# EAGLE design pcb_khamex_zenit_V0.1_rev_5.0 (EAGLE 7.6.0)

## Sheet 1 of 2
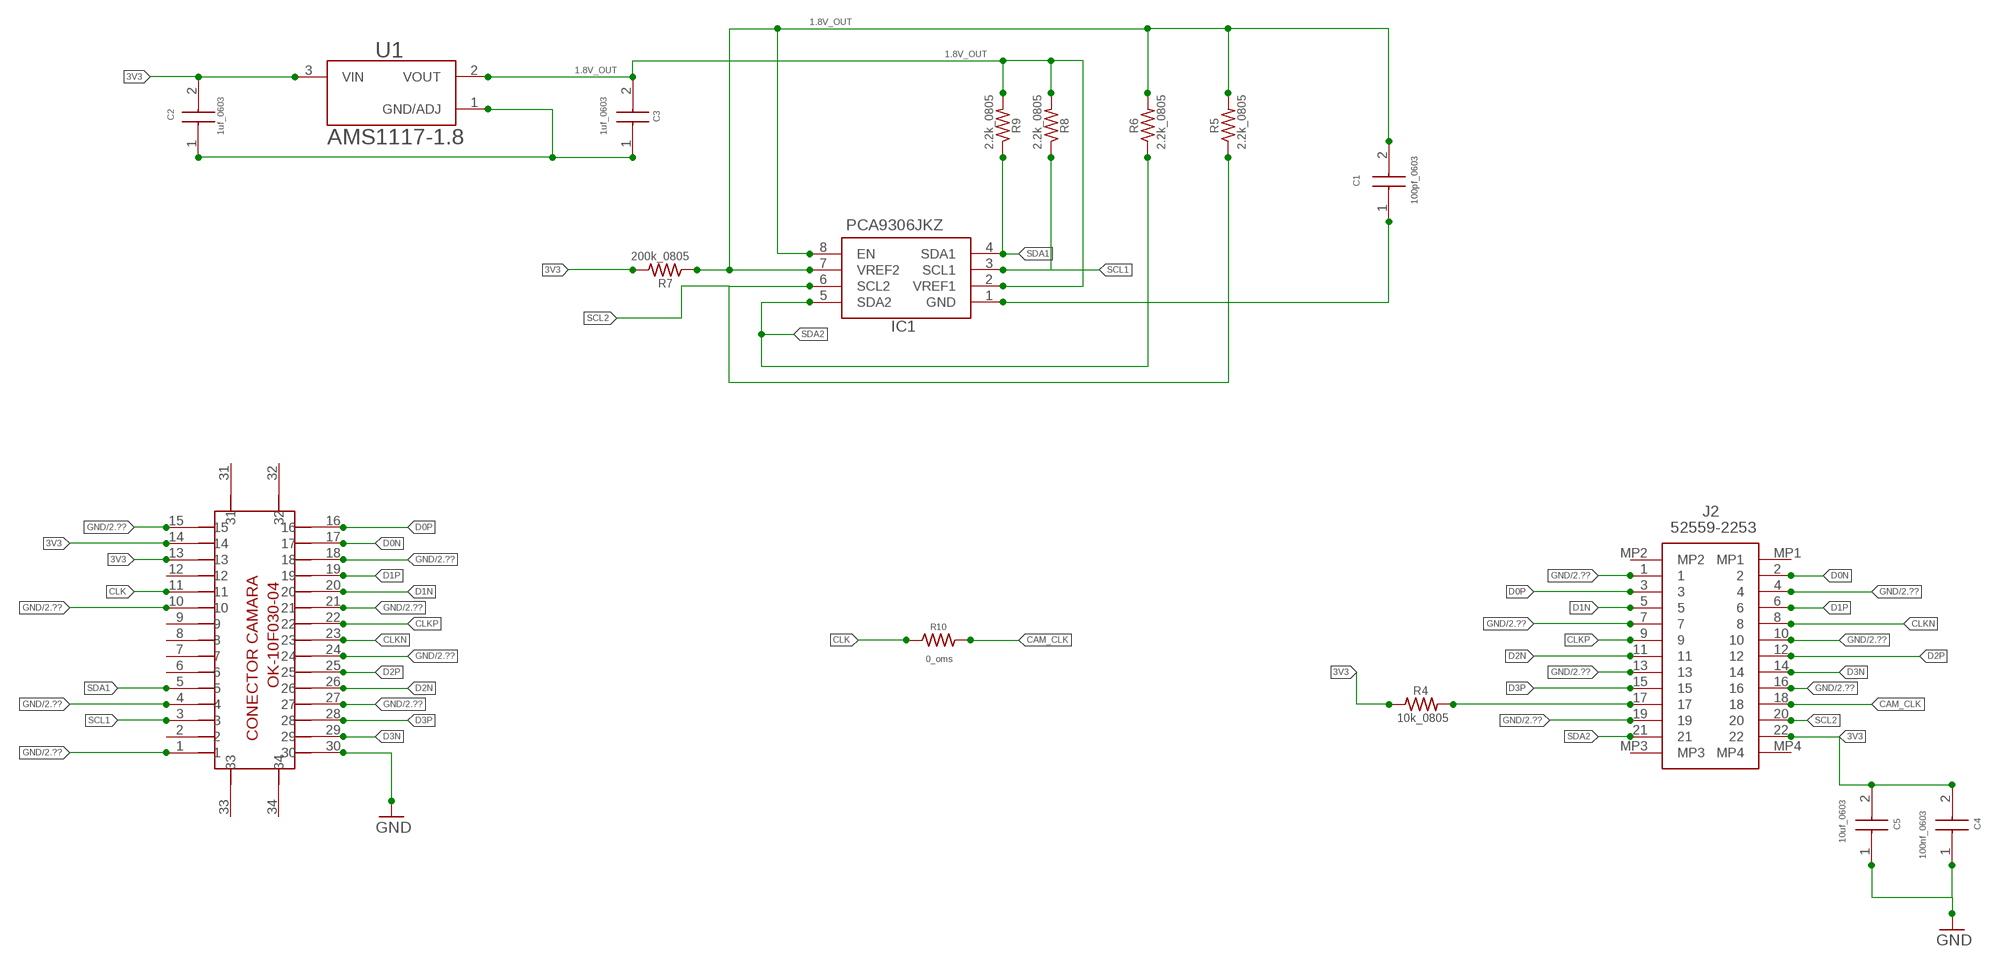
[diagram p0: schematic, sheet 1, part 1 of 2]
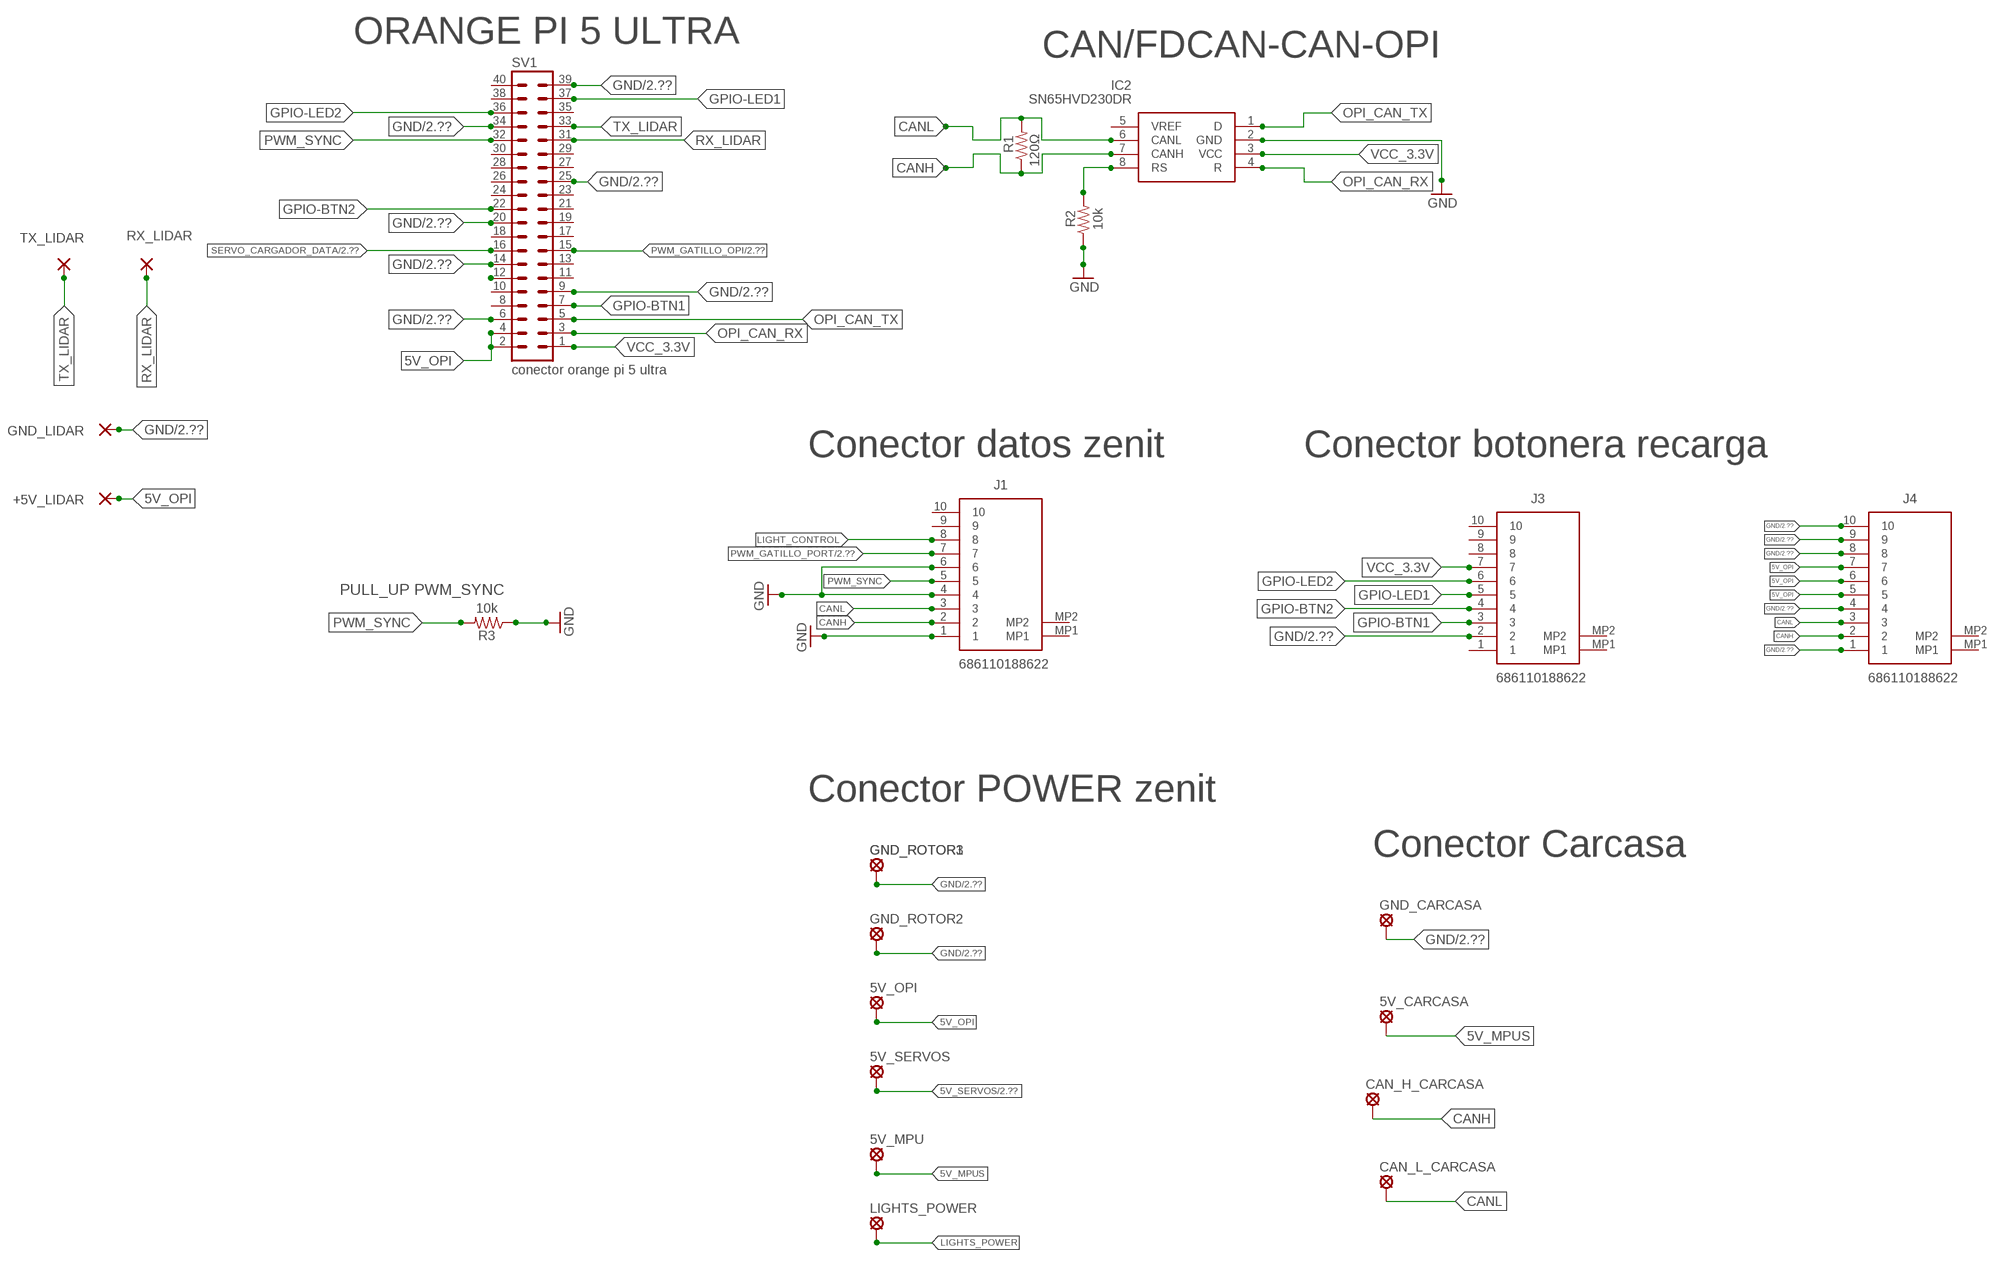
[diagram p1: schematic, sheet 1, part 2 of 2]

### Parts
5V_CARCASA  SE14  [SE14]
5V_MPU  SE14  [SE14]
5V_OPI  SE14  [SE14]
5V_SERVOS  SE14  [SE14]
+5V_LIDAR  WIREPAD1,6/0,8  [1,6/0,8]
C1  100pf_0603  06033U101FAT2A  [CAPC1608X90N]
C2  1uf_0603  06033U101FAT2A  [CAPC1608X90N]
C3  1uf_0603  06033U101FAT2A  [CAPC1608X90N]
C4  100nf_0603  06033U101FAT2A  [CAPC1608X90N]
C5  10uf_0603  06033U101FAT2A  [CAPC1608X90N]
CAN_H_CARCASA  SE14  [SE14]
CAN_L_CARCASA  SE14  [SE14]
GND_CARCASA  SE14  [SE14]
GND_LIDAR  WIREPAD1,6/0,8  [1,6/0,8]
GND_ROTOR1  SE14  [SE14]
GND_ROTOR2  SE14  [SE14]
GND_ROTOR3  SE14  [SE14]
IC1  PCA9306JKZ  [PCA9306JKZ]
IC2  SN65HVD230DR  [SOT127P600X175-8N]
J1  686110188622  [686110188622]
J2  52559-2253  [525592253]
J3  686110188622  [686110188622]
J4  686110188622  [686110188622]
LIGHTS_POWER  SE14  [SE14]
R1  120Ω  R-US_M0805  [M0805]
R2  10k  R-US_M0805  [M0805]
R3  10k  R-US_R0603  [R0603]
R4  10k_0805  R-US_M0805  [M0805]
R5  2.2k_0805  R-US_M0805  [M0805]
R6  2.2k_0805  R-US_M0805  [M0805]
R7  200k_0805  R-US_M0805  [M0805]
R8  2.2k_0805  R-US_M0805  [M0805]
R9  2.2k_0805  R-US_M0805  [M0805]
R10  0_oms  R-US_M0805  [M0805]
RX_LIDAR  WIREPAD1,6/0,8  [1,6/0,8]
SV1  conector orange pi 5 ultra  MA20-2  [MA20-2]
TX_LIDAR  WIREPAD1,6/0,8  [1,6/0,8]
U1  AMS1117-1.8  [SOT229P700X180-4N]
U$1  OK-10F030-04_DEVICE  [OK-10F030-04_PACKAGE]

### Nets
3V3: C2.2 C4.2 C5.2 J2.22 R4.1 R7.2 U1.3(VIN) U$1.13 U$1.14
5V_MPUS: 5V_CARCASA.MP 5V_MPU.MP
5V_OPI: 5V_OPI.MP +5V_LIDAR.1(P) J4.5 J4.6 J4.7 SV1.2 SV1.4
5V_SERVOS: 5V_SERVOS.MP ; also sheet 2
CAM_CLK: J2.18 R10.2
CANH: CAN_H_CARCASA.MP IC2.7(CANH) J1.2 J4.2 R1.1
CANL: CAN_L_CARCASA.MP IC2.6(CANL) J1.3 J4.3 R1.2
CLK: R10.1 U$1.11
CLKN: J2.8 U$1.23
CLKP: J2.9 U$1.22
D0N: J2.2 U$1.17
D0P: J2.3 U$1.16
D1N: J2.5 U$1.20
D1P: J2.6 U$1.19
D2N: J2.11 U$1.26
D2P: J2.12 U$1.25
D3N: J2.14 U$1.29
D3P [power]: J2.15 U$1.28
GND [power]: C4.1 C5.1 GND_CARCASA.MP GND_LIDAR.1(P) GND_ROTOR1.MP GND_ROTOR2.MP GND_ROTOR3.MP IC2.2(GND) J1.1 J1.4 J1.6 J2.1 J2.4 J2.7 J2.10 J2.13 J2.16 J2.19 J3.2 J4.1 J4.4 J4.8 J4.9 J4.10 R2.1 R3.1 SV1.6 SV1.9 SV1.14 SV1.20 SV1.25 SV1.34 SV1.39 U$1.1 U$1.4 U$1.10 U$1.15 U$1.18 U$1.21 U$1.24 U$1.27 U$1.30 ; also sheet 2
GPIO-BTN1: J3.3 SV1.7
GPIO-BTN2: J3.4 SV1.22
GPIO-LED1: J3.5 SV1.37
GPIO-LED2: J3.6 SV1.36
LIGHT_CONTROL: J1.8
LIGHTS_POWER [power]: LIGHTS_POWER.MP
N$1: C1.1 IC1.1(GND)
N$6: C1.2 IC1.7(VREF2) IC1.8(EN) R5.2 R6.2 R7.1
N$7: J2.17 R4.2
N$9: SV1.12
N$10: C2.1 C3.1 U1.1(GND/ADJ)
N$12: C3.2 IC1.2(VREF1) R8.2 R9.2 U1.2(VOUT)
N$15: IC2.8(RS) R2.2
OPI_CAN_RX: IC2.4(R) SV1.3
OPI_CAN_TX: IC2.1(D) SV1.5
PWM_GATILLO_OPI: SV1.15 ; also sheet 2
PWM_GATILLO_PORT: J1.7 ; also sheet 2
PWM_SYNC: J1.5 R3.2 SV1.32
RX_LIDAR: RX_LIDAR.1(P) SV1.31
SCL1: IC1.3(SCL1) R8.1 U$1.3
SCL2: IC1.6(SCL2) J2.20 R5.1
SDA1: IC1.4(SDA1) R9.1 U$1.5
SDA2: IC1.5(SDA2) J2.21 R6.1
SERVO_CARGADOR_DATA: SV1.16 ; also sheet 2
TX_LIDAR: SV1.33 TX_LIDAR.1(P)
VCC_3.3V: IC2.3(VCC) J3.7 SV1.1
Unconnected: IC2.5(VREF) J1.9 J1.10 J1.MP1 J1.MP2 J2.MP1 J2.MP2 J2.MP3 J2.MP4 J3.1 J3.8 J3.9 J3.10 J3.MP1 J3.MP2 J4.MP1 J4.MP2 SV1.8 SV1.10 SV1.11 SV1.13 SV1.17 SV1.18 SV1.19 SV1.21 SV1.23 SV1.24 SV1.26 SV1.27 SV1.28 SV1.29 SV1.30 SV1.35 SV1.38 SV1.40 U$1.2 U$1.6 U$1.7 U$1.8 U$1.9 U$1.12 U$1.31 U$1.32 U$1.33 U$1.34

### Notes on the sheet
- 1.8V_OUT
- 1.8V_OUT
- 1.8V_OUT
- ORANGE PI 5 ULTRA
- CAN/FDCAN-CAN-OPI
- Conector datos zenit | Conector botonera recarga
- PULL_UP PWM_SYNC
- Conector POWER zenit
- Conector Carcasa

## Sheet 2 of 2
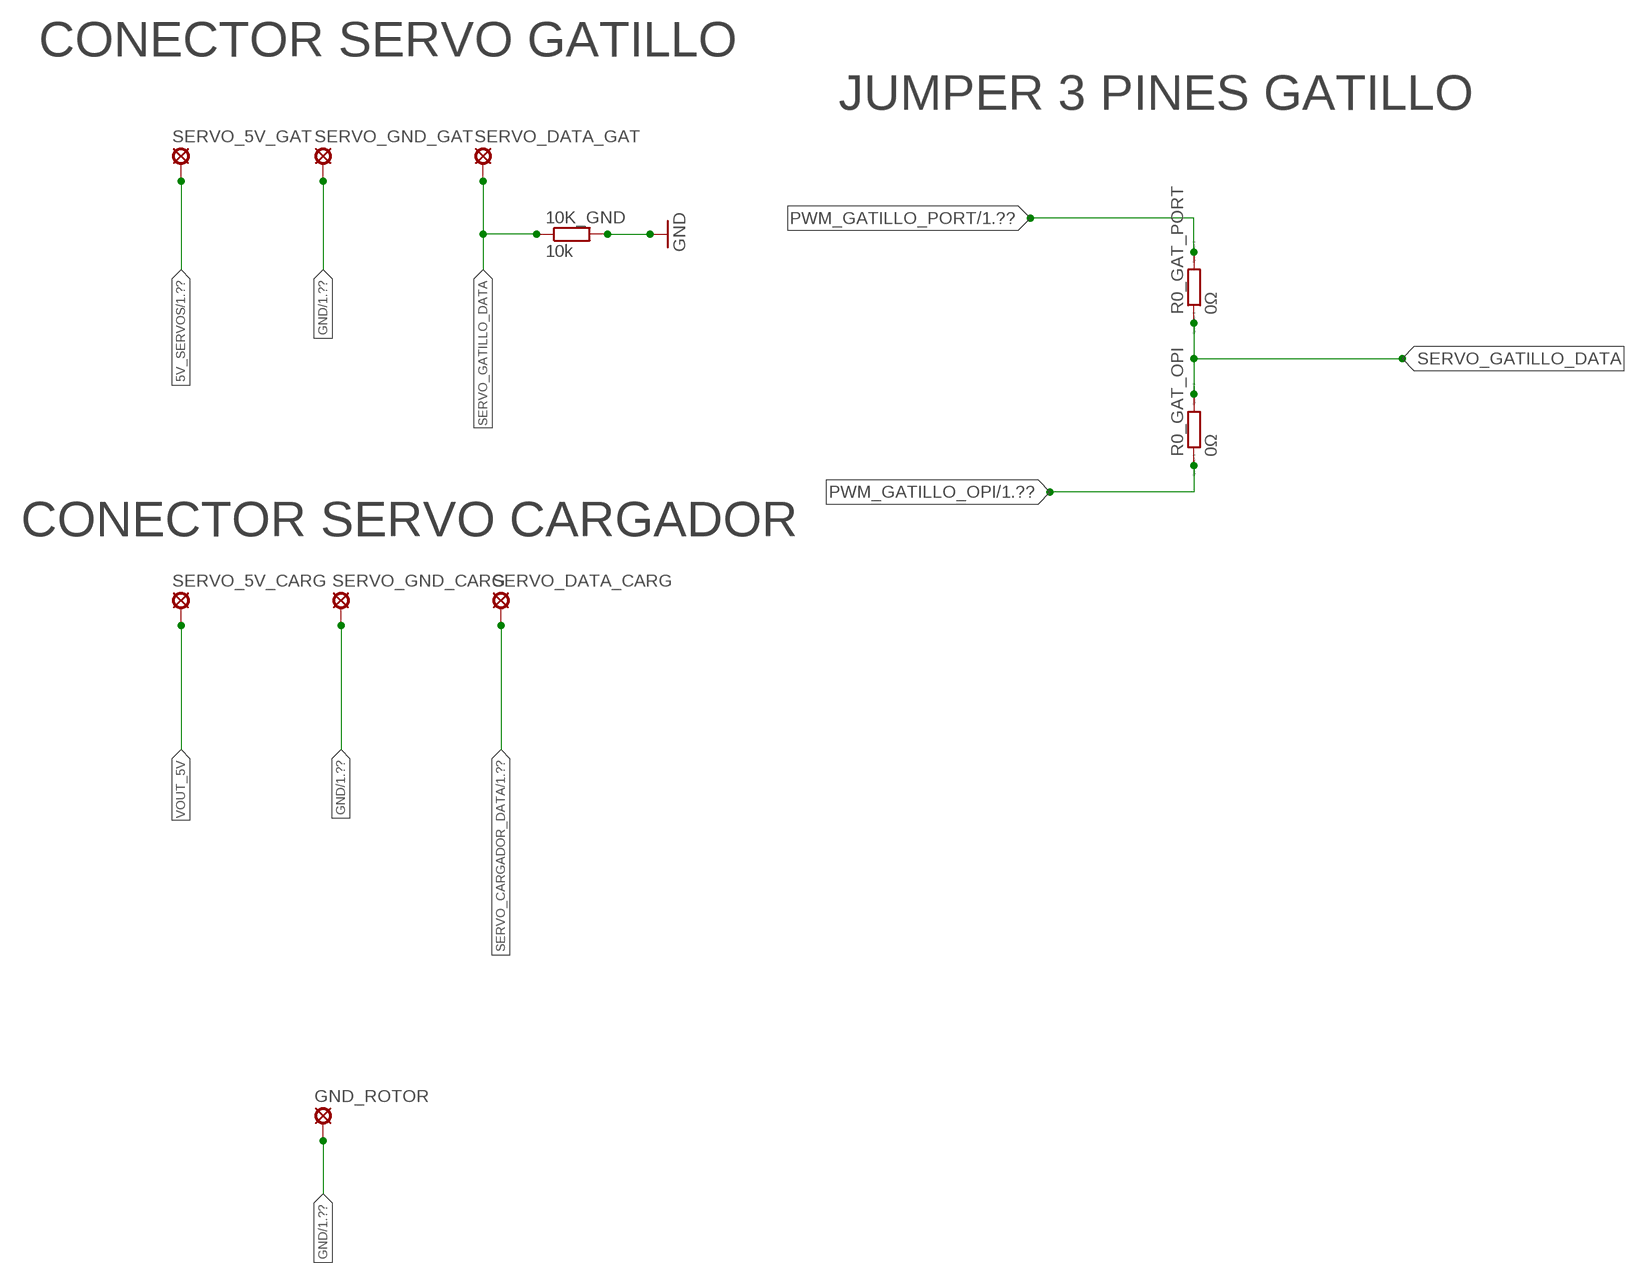
[diagram p2: schematic, sheet 2]

### Parts
10K_GND  10k  R-EU_R0603  [R0603]
GND_ROTOR  SE14  [SE14]
R0_GAT_OPI  0Ω  RR0603  [R0603]
R0_GAT_PORT  0Ω  RR0603  [R0603]
SERVO_5V_CARG  SE14  [SE14]
SERVO_5V_GAT  SE14  [SE14]
SERVO_DATA_CARG  SE14  [SE14]
SERVO_DATA_GAT  SE14  [SE14]
SERVO_GND_CARG  SE14  [SE14]
SERVO_GND_GAT  SE14  [SE14]

### Nets
5V_SERVOS: SERVO_5V_GAT.MP ; also sheet 1
GND [power]: 10K_GND.2 GND_ROTOR.MP SERVO_GND_CARG.MP SERVO_GND_GAT.MP ; also sheet 1
PWM_GATILLO_OPI: R0_GAT_OPI.1 ; also sheet 1
PWM_GATILLO_PORT: R0_GAT_PORT.2 ; also sheet 1
SERVO_CARGADOR_DATA: SERVO_DATA_CARG.MP ; also sheet 1
SERVO_GATILLO_DATA: 10K_GND.1 R0_GAT_OPI.2 R0_GAT_PORT.1 SERVO_DATA_GAT.MP
VOUT_5V: SERVO_5V_CARG.MP

### Notes on the sheet
- CONECTOR SERVO GATILLO
- JUMPER 3 PINES GATILLO
- CONECTOR SERVO CARGADOR

## Library data of the parts
5V_CARCASA 5V_MPU 5V_OPI 5V_SERVOS CAN_H_CARCASA CAN_L_CARCASA GND_CARCASA GND_ROTOR GND_ROTOR1-GND_ROTOR3 LIGHTS_POWER SERVO_5V_CARG SERVO_5V_GAT SERVO_DATA_CARG SERVO_DATA_GAT SERVO_GND_CARG SERVO_GND_GAT = solpad:SE14: SOLDER PAD E1553, drill 1,4mm, distributor Buerklin, 07F820
10K_GND = rcl_dani:R-EU_: RESISTOR, European symbol
+5V_LIDAR GND_LIDAR RX_LIDAR TX_LIDAR = wirepad:WIREPAD: Wire PAD connect wire on PCB
C1-C5 = 06033U101FAT2A:06033U101FAT2A: Multilayer Ceramic Capacitors MLCC - SMD/SMT 25V 100pF C0G 0603 1% Tol Source: Datasheet <https://componentsearchengine.com/Datasheets/1/06031A100FAT2A.pdf>; DESCRIPTION: Multilayer Ceramic Capacitors MLCC - SMD/SMT 25V 100pF C0G 0603 1% Tol; HEIGHT: 0.9mm; MANUFACTURER_NAME: Kyocera AVX; MANUFACTURER_PART_NUMBER: 06033U101FAT2A
IC1 = PCA9306JKZ:PCA9306JKZ: Voltage Level Translator Bidirectional 1 Circuit 2 Channel 8-X2SON (1.35x1) , 1.8 V ~ 5.5 V , -40C ~ 105C (TA) Source: Datasheet <https://www.nxp.com/docs/en/data-sheet/PCA9306.pdf>; DESCRIPTION: Voltage Level Translator Bidirectional 1 Circuit 2 Channel 8-X2SON (1.35x1) , 1.8 V ~ 5.5 V , -40C ~ 105C (TA); HEIGHT: 0.33mm; MANUFACTURER_NAME: NXP; MANUFACTURER_PART_NUMBER: PCA9306JKZ
IC2 = SN65HVD230DR:SN65HVD230DR: 3.3 V CAN Transceiver with Standby Mode Source: Datasheet <http://www.ti.com/lit/gpn/sn65hvd230>; DESCRIPTION: 3.3 V CAN Transceiver with Standby Mode; HEIGHT: 1.75mm; MANUFACTURER_NAME: Texas Instruments; MANUFACTURER_PART_NUMBER: SN65HVD230DR; MOUSER_PART_NUMBER: 595-SN65HVD230DR; MOUSER_PRICE-STOCK: https://www.mouser.co.uk/ProductDetail/Texas-Instruments/SN65HVD230DR?qs=QViXGNcIEAtifeQR3pYVUQ%3D%3D
J1 J3 J4 = 686110188622:686110188622: FFC & FPC Connectors WR-FPC 1,0mm SMT Horiz. Top Contact Tin Plating{0000} Source: Datasheet <https://www.mouser.ch/datasheet/2/445/686110188622-1843591.pdf>; DESCRIPTION: FFC & FPC Connectors WR-FPC 1,0mm SMT Horiz. Top Contact Tin Plating{0000}; HEIGHT: 3.3mm; MANUFACTURER_NAME: Wurth Elektronik; MANUFACTURER_PART_NUMBER: 686110188622; MOUSER_PART_NUMBER: 710-686110188622; MOUSER_PRICE-STOCK: https://www.mouser.co.uk/ProductDetail/Wurth-Elektronik/686110188622?qs=OlC7AqGiEDnHUpT6yh27Lg%3D%3D
J2 = 52559-2253:52559-2253: 0.5 MM FPC CONNECTOR Source: Datasheet; DESCRIPTION: 0.5 MM FPC CONNECTOR; HEIGHT: 5.55mm; MANUFACTURER_NAME: Molex; MANUFACTURER_PART_NUMBER: 52559-2253; MOUSER_PART_NUMBER: 538-52559-2253; MOUSER_PRICE-STOCK: https://www.mouser.co.uk/ProductDetail/Molex/52559-2253?qs=nDwhpid8gJaCOR81Wp3jsw%3D%3D
R0_GAT_OPI R0_GAT_PORT = eagle-ltspice:R: RESISTOR, European symbol; SPICEMODEL: NONE; SPICEPREFIX: R
R1-R10 = rcl:R-US_: RESISTOR, American symbol
SV1 = con-lstb:MA20-2: PIN HEADER; OC_FARNELL: unknown; OC_NEWARK: unknown
U1 = AMS1117-1.8:AMS1117-1.8: Check availability <https://pricing.snapeda.com/parts/AMS1117-1.8-TR/ams/view-part?ref=eda>; AVAILABILITY: Not in stock; CHECK_PRICES: https://www.snapeda.com/parts/AMS1117-1.8-TR/ams/view-part/?ref=eda; MF: ams; MP: AMS1117-1.8-TR; PACKAGE: SOT-223 Seeed Technology; PRICE: None; SNAPEDA_LINK: https://www.snapeda.com/parts/AMS1117-1.8-TR/ams/view-part/?ref=snap
U$1 = OK-10F030-04_LIBRARY_2:OK-10F030-04_DEVICE: Conector para las camaras del Orange Pi 5 Ultra 30 pines click

## Net classes
0 default: width 0.152 mm, drill 0.305 mm, clearance 0.152 mm
1 power: width 0.127 mm, drill 0.305 mm, clearance 0.127 mm
2 thin: width 0.254 mm, drill 0.254 mm, clearance 0.254 mm
3 mipi: width 0.15 mm, drill 0.2 mm, clearance 0.15 mm

## Board
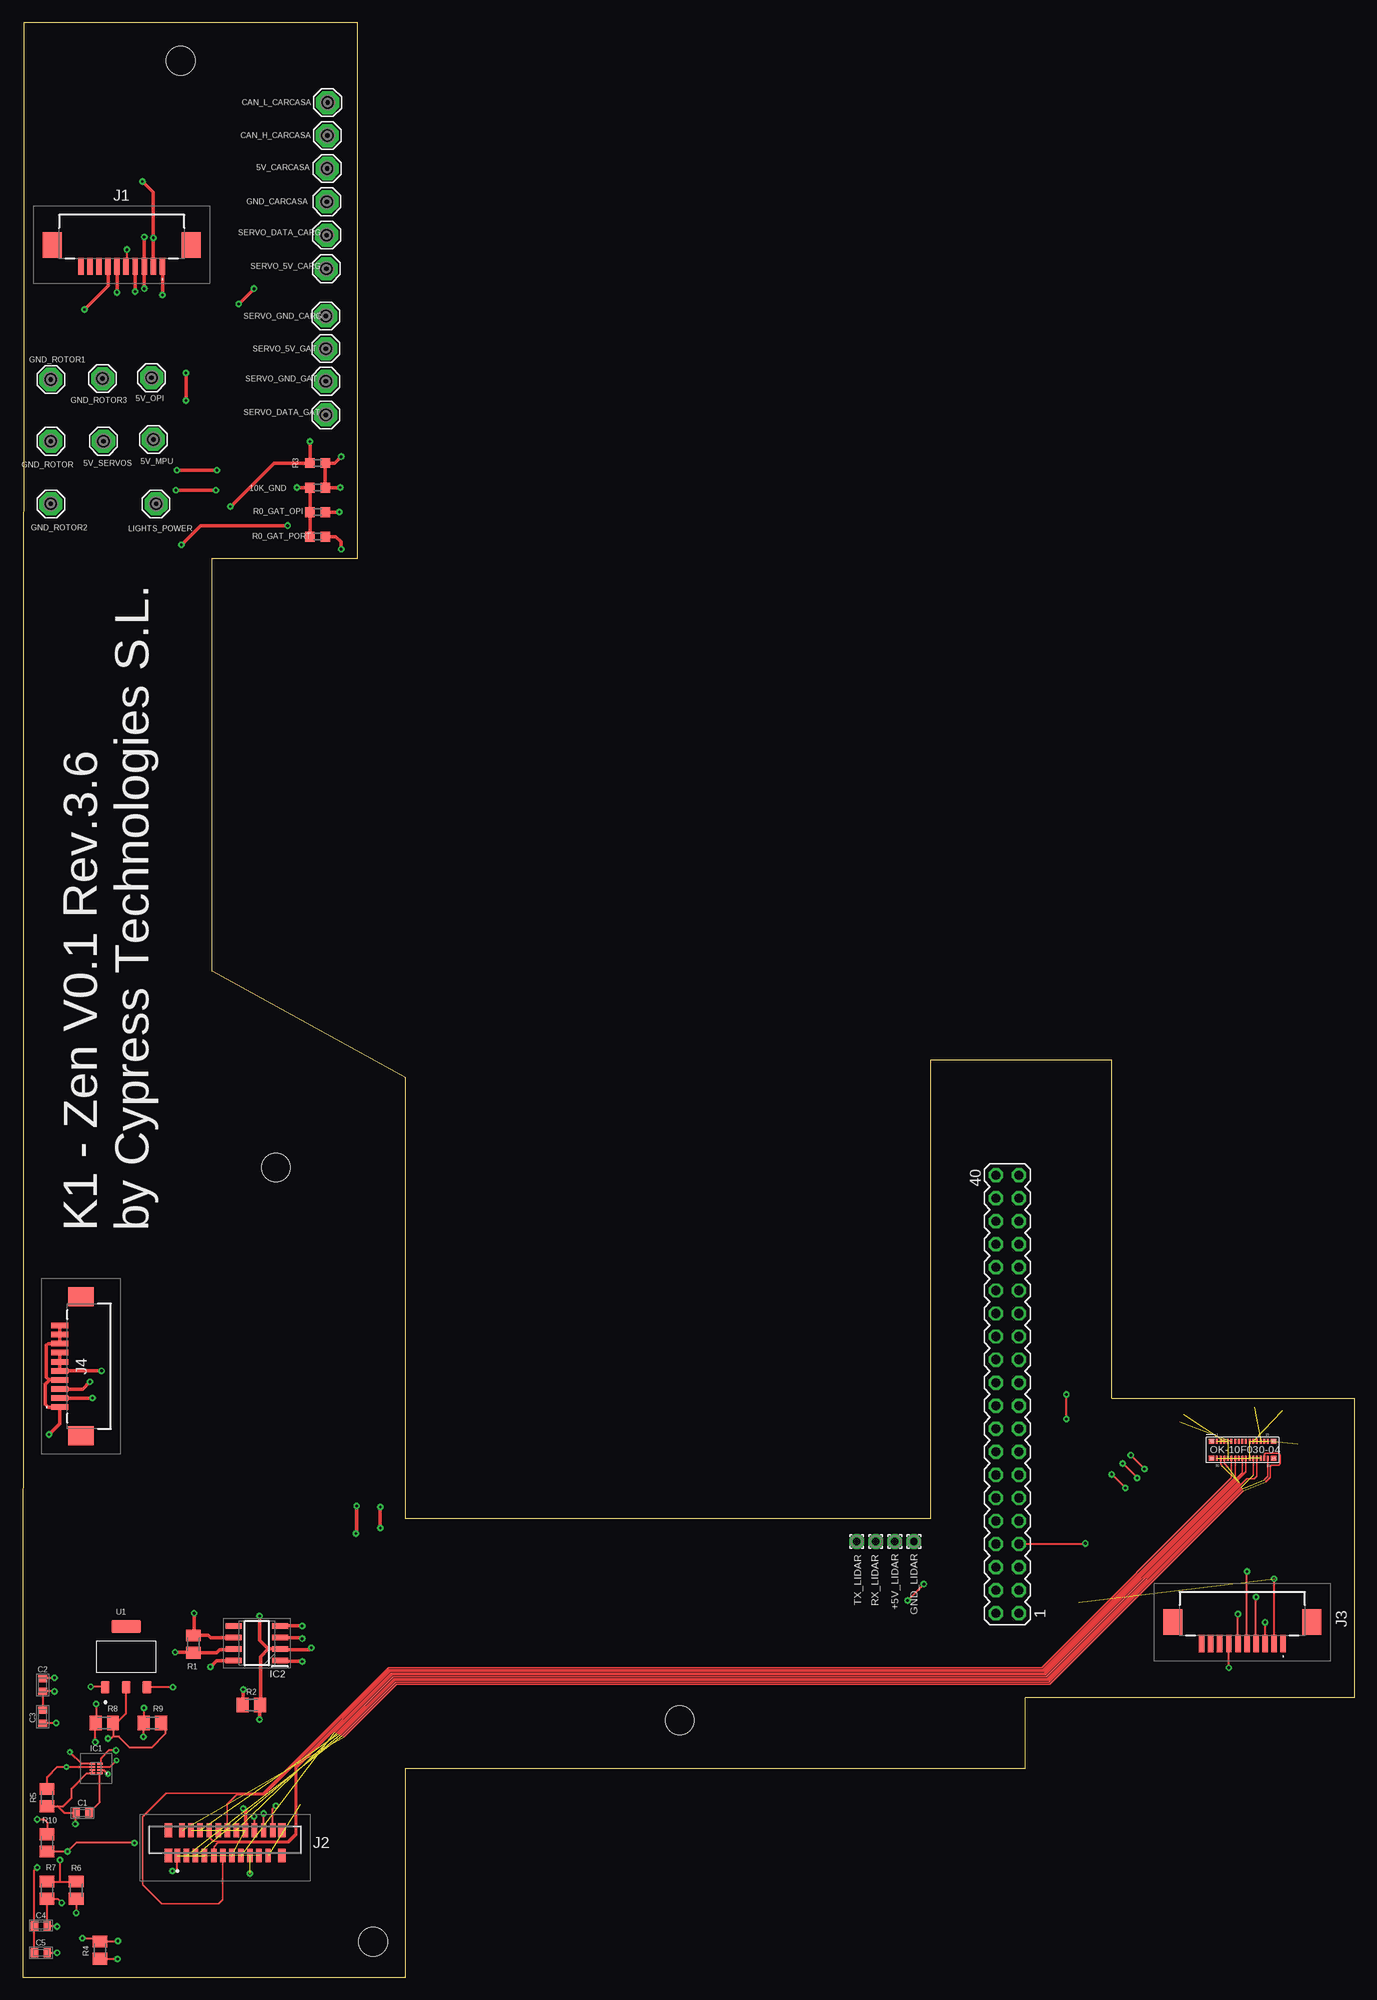
[diagram p3: board, top side]
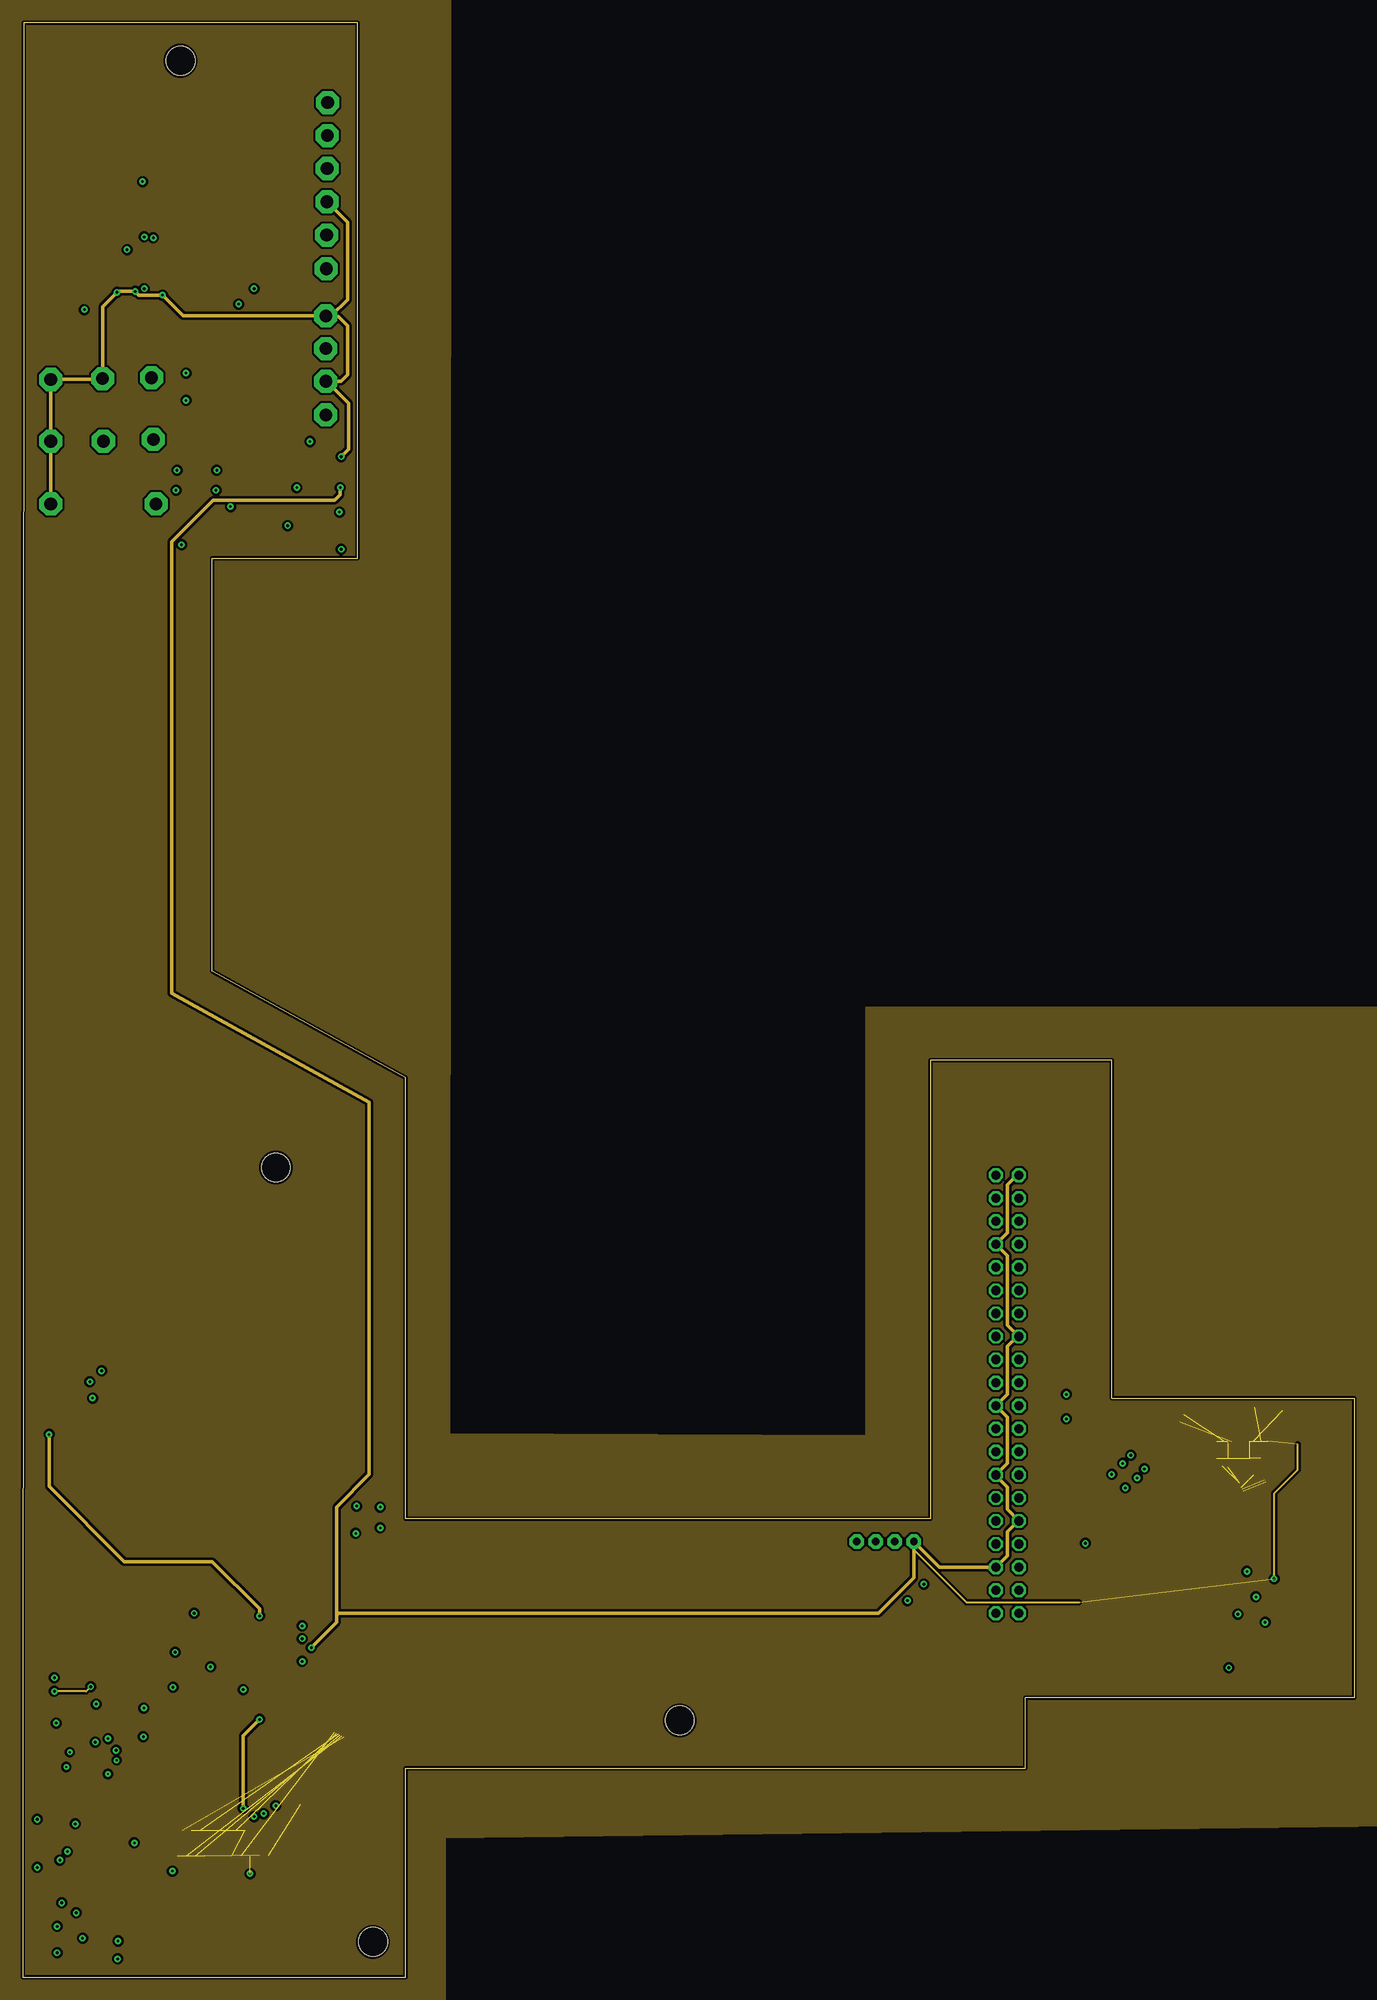
[diagram p4: board, inner layer GND_PLANE]
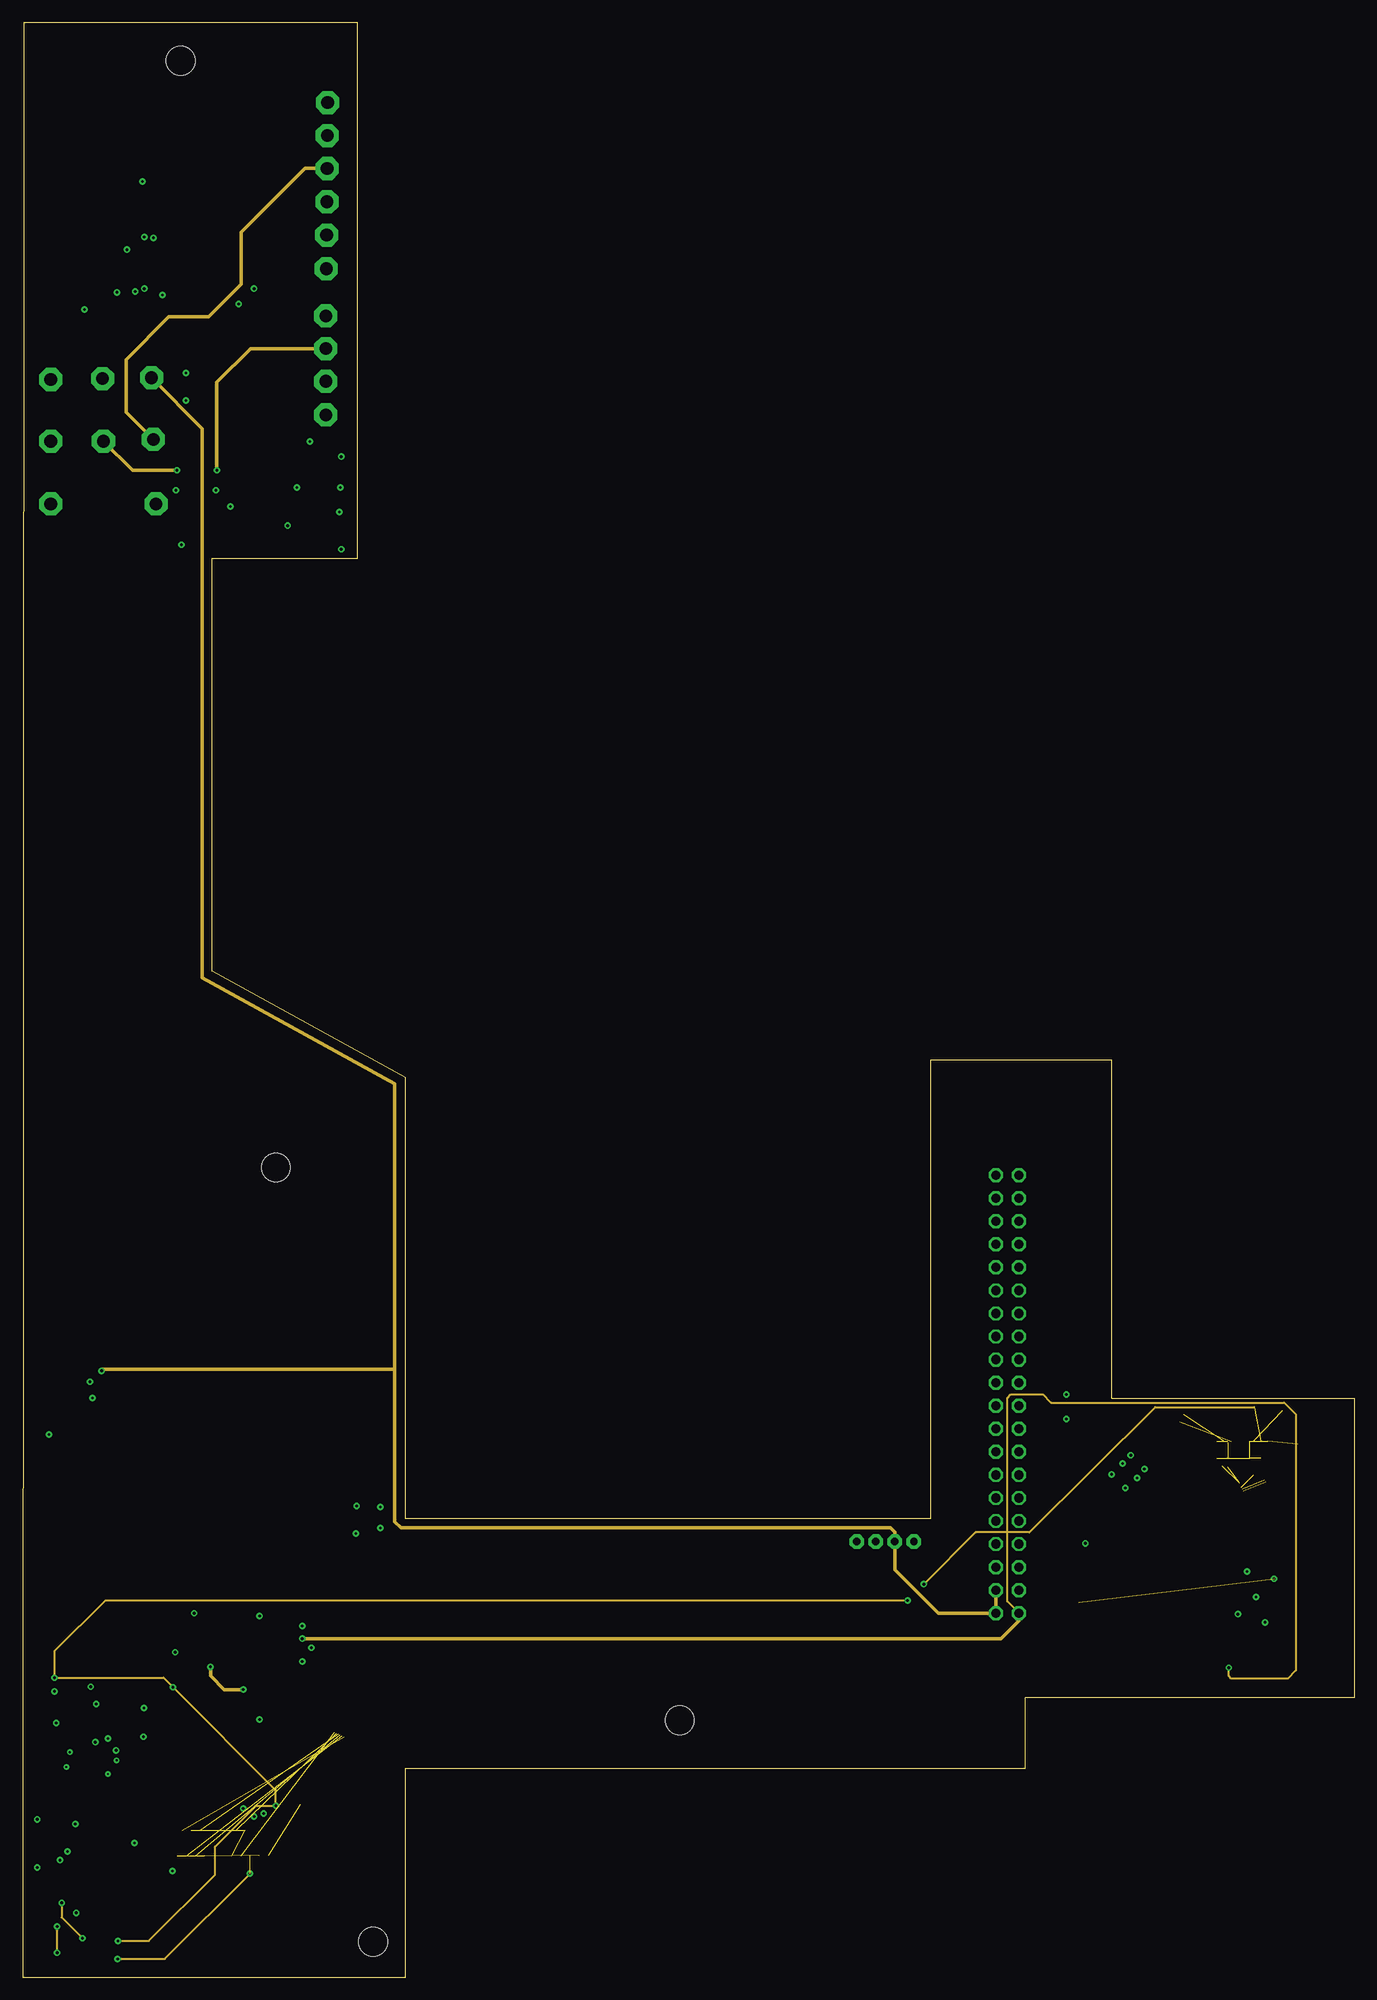
[diagram p5: board, inner layer POWER]
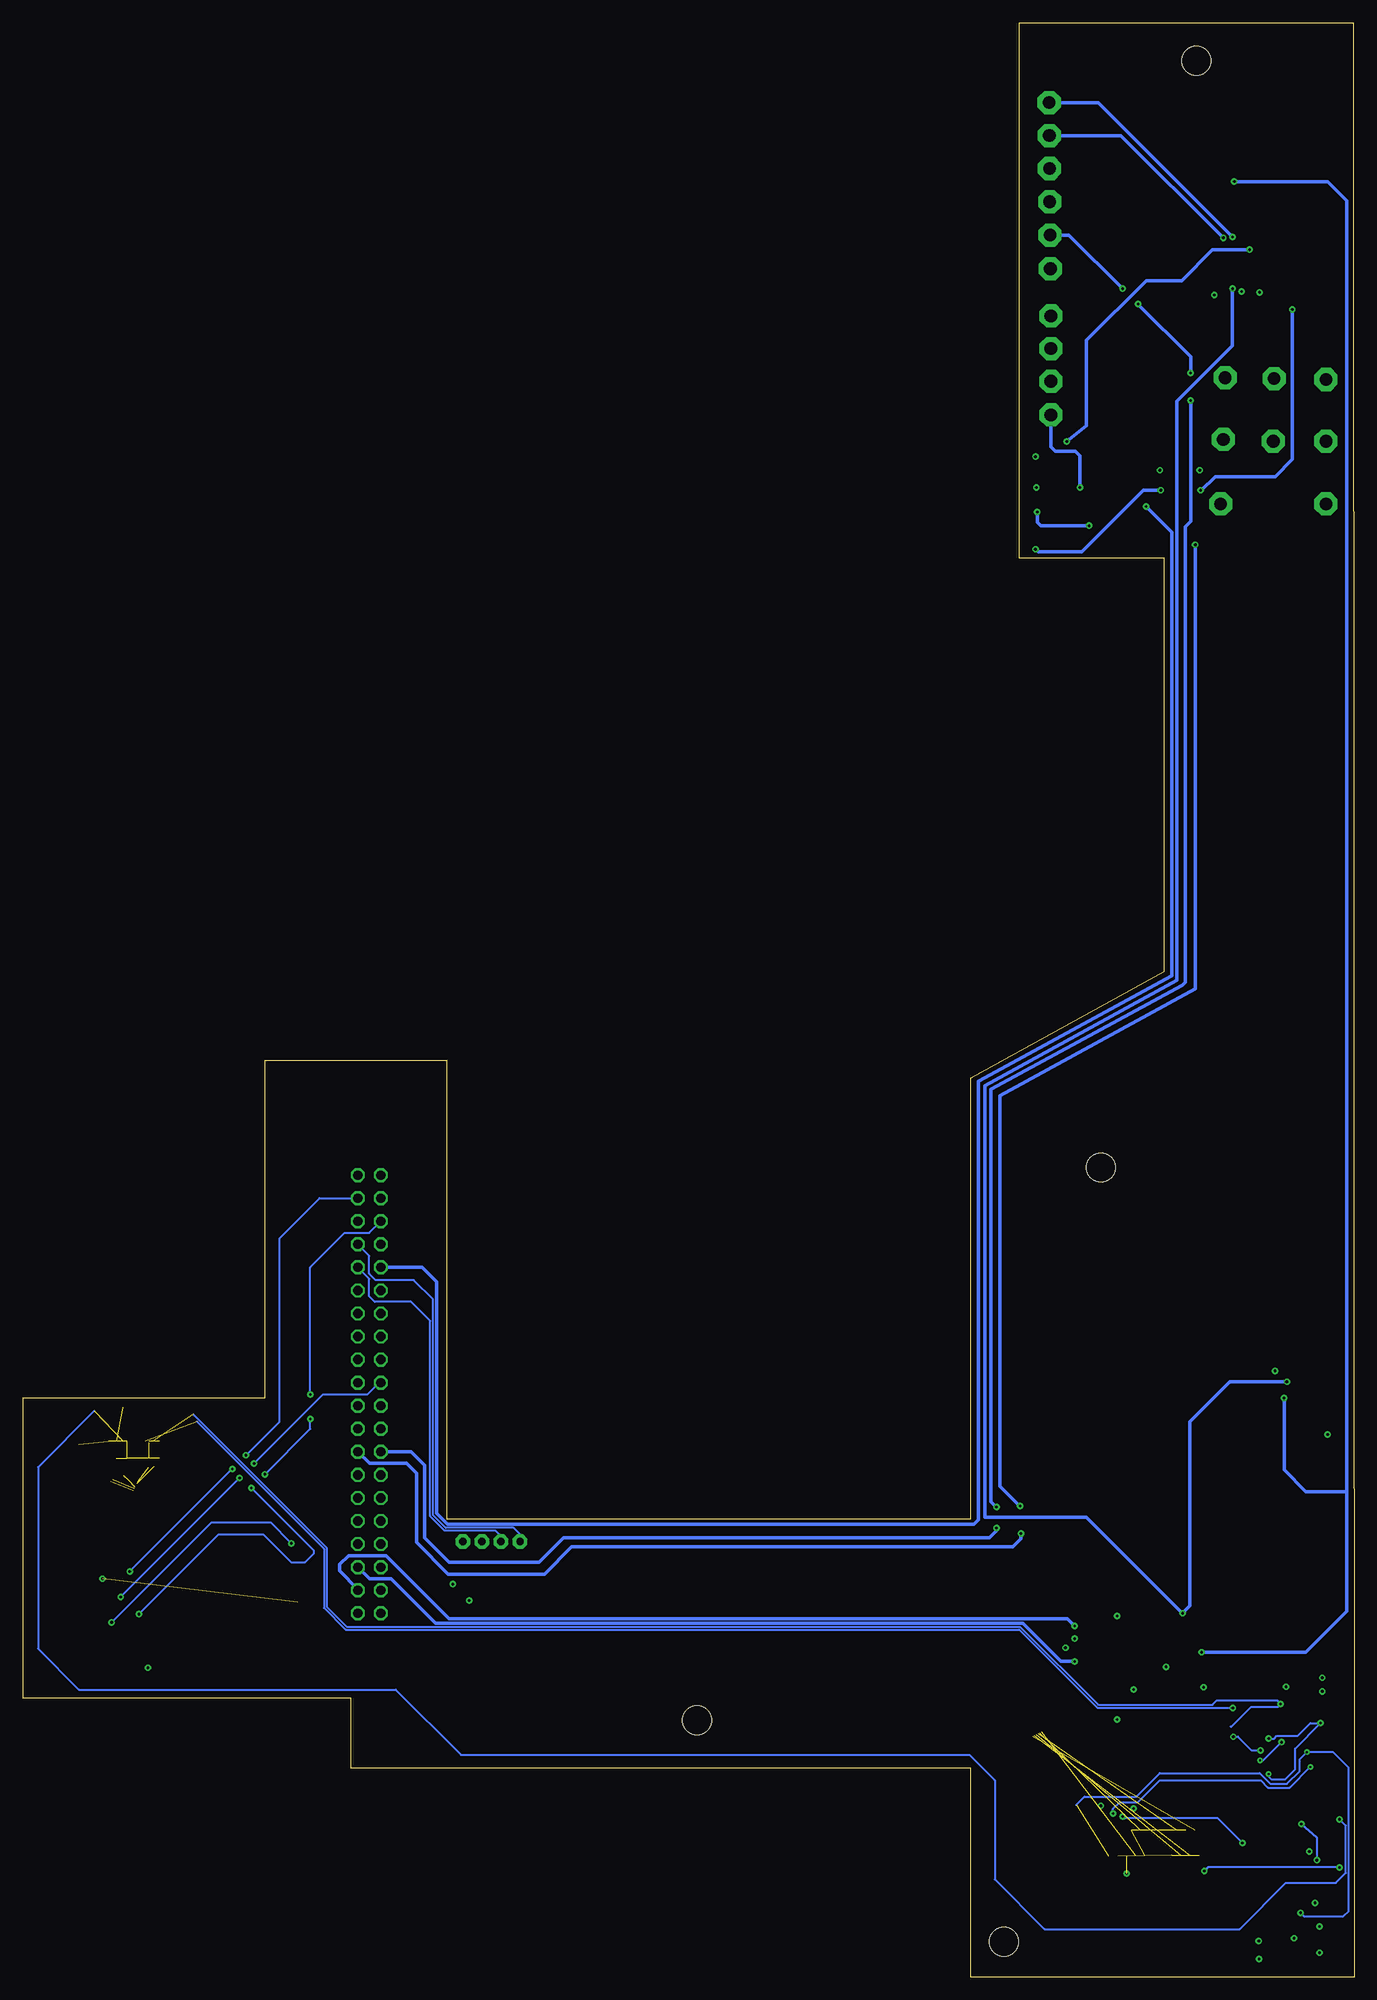
[diagram p6: board, bottom side, seen from below]

Size 146.7 x 215.3 mm. Coordinates in mm from the lower left corner, seen from the top.
Outline: 0,0 42.2,0 42.2,23 110.5,23 110.5,30.8 146.7,30.8 146.7,63.8 120,63.8 120,101 100,101 100,50.5 42.2,50.5 42.2,99.1 20.9,110.8 20.9,156.3 36.9,156.3 36.9,215.3 0.1,215.3 0,0
Copper layers (1*2*15*16): Top 0.035mm / dielectric 1.5mm / GND_PLANE 0.035mm / dielectric 0.15mm / POWER 0.035mm / dielectric 0.2mm / Bottom 0.035mm
Design rules "default *": minimum track width 10mil, minimum drill 24mil, track to track 8mil, track to pad 8mil, pad to pad 8mil, via to via 8mil, smd to smd 8mil, copper to edge 10mil, drill to drill 8mil, minimum pad ring 10mil, minimum via ring 8mil, stop-mask expansion 4mil, vias tented up to drill 0mil, thermal gap 10mil
Holes 3.2 mm at 17.4,211.1 72.4,28.3 38.6,3.9 27.9,89.2

### Footprints (pad centres in the part's own frame; a part is rotated, then mirrored left to right if it is on the bottom)
SE14 = drill 1.397 pad 2.54 octagon: MP 0,0
R0603 = smd 1 x 1.1: 1 -0.85,0; 2 0.85,0
1,6/0,8 = drill 0.813 pad 1.6 octagon: 1 0,0
CAPC1608X90N = smd 0.78 x 0.99: 1 -0.7,0; 2 0.7,0
PCA9306JKZ = smd 0.65 x 0.17: 1 -0.4,0.525 | smd 0.6 x 0.17: 2 -0.425,0.175; 3 -0.425,-0.175; 4 -0.425,-0.525; 5 0.425,-0.525; 6 0.425,-0.175; 7 0.425,0.175; 8 0.425,0.525
SOT127P600X175-8N = smd 1.75 x 0.6: 1 -2.55,1.905; 2 -2.55,0.635; 3 -2.55,-0.635; 4 -2.55,-1.905; 5 2.55,-1.905; 6 2.55,-0.635; 7 2.55,0.635; 8 2.55,1.905
686110188622 = smd 0.6 x 1.9: 1 -4.5,2.825; 2 -3.5,2.825; 3 -2.5,2.825; 4 -1.5,2.825; 5 -0.5,2.825; 6 0.5,2.825; 7 1.5,2.825; 8 2.5,2.825; 9 3.5,2.825; 10 4.5,2.825 | smd 2.1 x 2.8: MP1 -7.65,0.475; MP2 7.65,0.475
525592253 = smd 0.6 x 1.5: 1 -5.25,-1.4; 2 -4.75,1.4; 3 -4.25,-1.4; 4 -3.75,1.4; 5 -3.25,-1.4; 6 -2.75,1.4; 7 -2.25,-1.4; 8 -1.75,1.4; 9 -1.25,-1.4; 10 -0.75,1.4; 11 -0.25,-1.4; 12 0.25,1.4; 13 0.75,-1.4; 14 1.25,1.4; 15 1.75,-1.4; 16 2.25,1.4; 17 2.75,-1.4; 18 3.25,1.4; 19 3.75,-1.4; 20 4.25,1.4; 21 4.75,-1.4; 22 5.25,1.4 | smd 0.8 x 1.5: MP1 -6.25,1.4; MP2 -6.25,-1.4; MP3 6.25,-1.4; MP4 6.25,1.4
M0805 = smd 1.3 x 1.6: 1 -0.95,0; 2 0.95,0
MA20-2 = drill 1.016 octagon: 1 -24.13,-1.27; 2 -24.13,1.27; 3 -21.59,-1.27; 4 -21.59,1.27; 5 -19.05,-1.27; 6 -19.05,1.27; 7 -16.51,-1.27; 8 -16.51,1.27; 9 -13.97,-1.27; 10 -13.97,1.27; 11 -11.43,-1.27; 12 -11.43,1.27; 13 -8.89,-1.27; 14 -8.89,1.27; 15 -6.35,-1.27; 16 -6.35,1.27; 17 -3.81,-1.27; 18 -3.81,1.27; 19 -1.27,-1.27; 20 -1.27,1.27; 21 1.27,-1.27; 22 1.27,1.27; 23 3.81,-1.27; 24 3.81,1.27; 25 6.35,-1.27; 26 6.35,1.27; 27 8.89,-1.27; 28 8.89,1.27; 29 11.43,-1.27; 30 11.43,1.27; 31 13.97,-1.27; 32 13.97,1.27; 33 16.51,-1.27; 34 16.51,1.27; 35 19.05,-1.27; 36 19.05,1.27; 37 21.59,-1.27; 38 21.59,1.27; 39 24.13,-1.27; 40 24.13,1.27
SOT229P700X180-4N = smd 1.31 x 0.93: 1 -3.345,2.29; 2 -3.345,0; 3 -3.345,-2.29 | smd 1.31 x 3.24: 4 3.345,0
OK-10F030-04_PACKAGE = smd 0.22 x 0.55: 1 -2.8,0.925; 2 -2.4,0.925; 3 -2,0.925; 4 -1.6,0.925; 5 -1.2,0.925; 6 -0.8,0.925; 7 -0.4,0.925; 8 0,0.925; 9 0.4,0.925; 10 0.8,0.925; 11 1.2,0.925; 12 1.6,0.925; 13 2,0.925; 14 2.4,0.925; 15 2.8,0.925; 16 2.8,-0.925; 17 2.4,-0.925; 18 2,-0.925; 19 1.6,-0.925; 20 1.2,-0.925; 21 0.8,-0.925; 22 0.4,-0.925; 23 0,-0.925; 24 -0.4,-0.925; 25 -0.8,-0.925; 26 -1.2,-0.925; 27 -1.6,-0.925; 28 -2,-0.925; 29 -2.4,-0.925; 30 -2.8,-0.925 | smd 0.6 x 0.55: 31 -3.4,0.925; 32 -3.39,-0.935; 33 3.42,0.935; 34 3.42,-0.925

### Placement (x,y rotation side)
5V_CARCASA  33.55,199.24 180 top
5V_MPU  14.4,169.4 270 top
5V_OPI  14.2,176.2 270 top
5V_SERVOS  8.9,169.2 270 top
10K_GND  32.5,164.1 0 top
+5V_LIDAR  96.1,48 180 top
C1  6.6,18.1 180 top
C2  2.2,32.2 90 top
C3  2.2,28.7 270 top
C4  2,5.7 0 top
C5  2,2.7 0 top
CAN_H_CARCASA  33.57,202.87 180 top
CAN_L_CARCASA  33.6,206.5 180 top
GND_CARCASA  33.53,195.58 180 top
GND_LIDAR  98.2,48 180 top
GND_ROTOR  3.1,169.2 0 top
GND_ROTOR1  3.1,176 270 top
GND_ROTOR2  3.1,162.3 270 top
GND_ROTOR3  8.8,176.1 90 top
IC1  8.1,23 180 top
IC2  25.8,36.8 180 top
J1  10.9,191.3 180 top
J2  22.3,14.8 0 top
J3  134.4,39.6 180 top
J4  6.9,67.3 90 top
LIGHTS_POWER  14.7,162.3 270 top
R0_GAT_OPI  32.5,161.4 180 top
R0_GAT_PORT  32.5,158.7 0 top
R1  18.8,36.7 90 top
R2  25.2,30 180 top
R3  32.5,166.8 180 top
R4  8.5,3 270 top
R5  2.7,19.8 270 top
R6  5.9,9.6 90 top
R7  2.7,9.6 270 top
R8  9,28 0 top
R9  14.3,28 0 top
R10  2.7,14.8 270 top
RX_LIDAR  94,48 180 top
SERVO_5V_CARG  33.46,188.2 0 top
SERVO_5V_GAT  33.4,179.4 0 top
SERVO_DATA_CARG  33.5,191.9 0 top
SERVO_DATA_GAT  33.4,172.1 0 top
SERVO_GND_CARG  33.4,183 0 top
SERVO_GND_GAT  33.4,175.8 0 top
SV1  108.5,64.23 90 top
TX_LIDAR  91.9,48 180 top
U1  11.4,35.3 90 top
U$1  134.4,58.1 0 top

### Tracks (layer width: path | path; a pad name or v marks a point on that pad's centre or on a via)
3V3  (via drill 0.3, 0.3 pad 0.2)  (2 unrouted)
  Top 0.2: C5.2 v3.8,2.7 | v3.8,5.6 2.8,5.6 C4.2 R7.2 3.85,8.65 v4.3,8.2 | v6.6,4.3 8.15,4.3 R4.1 10.45,3.95 v10.5,4 | J2.22 27.55,18.55 v27.9,18.9 | v16.57,31.95 U1.3 | C2.2 2.3,33 v3.5,33 | v99.3,43.3 v97.5,41.5
  POWER 0.2: v3.8,2.7 v3.8,5.6 | v4.3,8.2 4.3,6.6 v6.6,4.3 | v10.5,4 13.9,4 21.2,11.3 21.2,14.4 25.7,18.9 v27.9,18.9 27.9,20.62 v16.57,31.95 15.52,33 v3.5,33 3.5,35.9 9.1,41.5 v97.5,41.5 | v99.3,43.3 105,49 110.9,49 124.8,62.8 135.7,62.8
5V_MPUS
  POWER 0.406: 5V_CARCASA.MP 31.14,199.24 24.1,192.2 24.1,186.5 20.5,182.9 16.1,182.9 11.4,178.2 11.4,172.4 5V_MPU.MP
5V_OPI  (via drill 0.3)
  Top 0.406: J4.7 J4.6 J4.5 v8.7,66.8
  POWER 0.406: 5V_OPI.MP 19.8,170.6 19.8,110.1 41,98.4 41,67 | 41,67 41,50.2 41.7,49.5 95.6,49.5 96.1,49 +5V_LIDAR.1 96.1,44.9 100.9,40.1 SV1.2 SV1.4 | v8.7,66.8 8.7,67 41,67
5V_SERVOS  (via drill 0.3)
  Top 0.406: v21.4,166 v17,166
  POWER 0.406: SERVO_5V_GAT.MP 25.1,179.4 21.4,175.7 v21.4,166 | v17,166 12.1,166 5V_SERVOS.MP
CAM_CLK  (via drill 0.3, 0.3 pad 0.2, 0.3 pad 0.3)
  Top 0.2: J2.18 arc90 25.5,16.15 | v12.3,14.8 5.88,14.8 v4.93,13.85 R10.2 | 25.6,16.25 J2.18 | v25.5,17.7 25.5,16.25 J2.18
  Bottom 0.2: v12.3,14.8 15,17.5 25.3,17.5 v25.5,17.7
CANH  (via drill 0.3)
  Top 0.406: IC2.7 23.18,36.1 21.7,36.1 21.35,35.75 R1.1 18.75,35.8 v16.8,35.8 | J1.2 v14.4,191.6 14.4,196.6 v13.2,197.8 | J4.2 v7.7,63.8
  Bottom 0.406: CAN_H_CARCASA.MP 25.67,202.87 v14.4,191.6 | v13.2,197.8 2.9,197.8 0.8,195.7 0.8,53.4 | 0.8,53.4 0.8,40.3 5.3,35.8 v16.8,35.8 | v7.7,63.8 7.7,55.9 5.3,53.5 0.9,53.5 0.8,53.4
CANL  (via drill 0.3)
  Top 0.406: v13.4,191.7 J1.3 v13.4,186 | v18.9,40.1 18.9,37.75 R1.2 20.45,37.65 20.7,37.4 23.21,37.4 IC2.6 | J4.3 6.6,64.8 v7.4,65.6
  Bottom 0.406: CAN_L_CARCASA.MP 28.2,206.5 v13.4,191.7 | v13.4,186 13.4,179.7 19.5,173.6 19.5,109.8 40.7,98.2 40.7,50.7 29.5,50.7 v18.9,40.1 18.1,40.9 18.1,61.2 13.7,65.6 v7.4,65.6
CLK  (via drill 0.3)  (1 unrouted)
  Top 0.2: v1.6,17.4 2.4,17.4 2.7,17.1 R10.1
  Bottom 0.2: 138.8,62.4 145,56.2 145,36.2 140.5,31.7 105.6,31.7 98.4,24.5 42.4,24.5 39.6,21.7 39.6,10.8 34.1,5.3 12.6,5.3 7.5,10.4 2,10.4 0.9,11.5 0.9,16.7 v1.6,17.4
CLKN
  Top 0.15: J2.8 20.55,15.45 21,15 29.2,15 30,15.8 30,23.2 40.5,33.7 112.5,33.7 134.4,55.6 U$1.23
CLKP
  Top 0.15: J2.9 21.1,13.45 21.1,14.4 21.5,14.8 29.3,14.8 30.2,15.7 30.2,23.1 40.6,33.5 112.6,33.5 134.8,55.7 U$1.22
  Top 0.2: J2.9 21.05,12.75
D0N  (2 unrouted)
  Top 0.15: 35.4,26.5 41.2,32.3 113.2,32.3 134.5,53.6 | U$1.17 136.8,57.6 136.9,57.7 138.4,57.7 138.6,57.5 138.6,56.6 138.4,56.4 137.6,56.4 137.5,56.3 137.5,55.1 137,54.6
D0P  (2 unrouted)
  Top 0.15: 134.4,53.8 113.1,32.5 41.1,32.5 35.2,26.6 | U$1.16 137.2,55.2 136.8,54.8
D1N  (3 unrouted)
  Top 0.15: 35,26.7 41,32.7 113,32.7 134.3,54 | U$1.20 135.6,55.3
D1P  (1 unrouted)
  Top 0.15: 34.8,26.8 40.9,32.9 112.9,32.9 134.9,54.9 135.7,54.9 136,55.2 U$1.19
D2N
  Top 0.15: J2.11 22.05,8.55 21.6,8.1 15.3,8.1 13.2,10.2 13.2,17.7 15.8,20.3 26.5,20.3 40.3,34.1 112.3,34.1 133.2,55 U$1.26
D2P
  Top 0.15: J2.12 22.55,19.05 23.6,20.1 26.6,20.1 40.4,33.9 112.4,33.9 133.6,55.1 U$1.25
D3N  (2 unrouted)
  Top 0.15: 34.6,26.9 40.8,33.1 112.8,33.1 134.1,54.4 | U$1.29 132,56.5 132.2,56.3
  Top 0.2: J2.14
D3P  (2 unrouted)
  Top 0.15: 34.4,27 40.7,33.3 112.7,33.3 134,54.6 | U$1.28 132.4,56.6 132.8,56.2
GND  (via drill 0.3, 0.3 pad 0.2)  (16 unrouted)
  Top 0.2: C5.1 C4.1 1.3,11.8 v1.6,12.1 | v16.5,11.7 16.98,11.7 17.02,11.74 17.02,13.37 J2.1 | 20.08,13.43 J2.7 | J2.10 | 23.07,13.42 J2.13 | 24.53,16.18 J2.16 | J3.2 v137.9,43.9 | U$1.4 132.8,58.9
  Top 0.406: 27.07,36.16 IC2.2 28.41,36.1 31.6,36.1 v31.8,36.3 | 27.07,36.16 26.2,35.3 26.2,30.05 R2.1 arc90 26.1,29.95 v26.1,28.4 | v24.3,18.6 24.55,18.35 J2.16 | J1.1 v15.4,185.3 | J1.4 v12.4,185.7 | v10.4,185.6 J1.6 | v35.1,167.5 34.4,166.8 R3.1 10K_GND.2 v35,164.1 | J4.10 J4.9 J4.8 2.8,69.8 2.6,69.6 2.6,66.1 2.9,65.8 J4.4 3,65.8 2.5,65.3 2.5,63.1 2.8,62.8 J4.1 4.08,60.98 v2.9,59.8 | v26.1,39.8 26.1,37.13 27.07,36.16
  GND_PLANE 0.2: v137.9,43.9 137.9,53.3 140.5,55.9 140.5,58.7 | GND_LIDAR.1 98.2,47.1 104,41.3 116.4,41.3
  GND_PLANE 0.406: SV1.39 109.56,88.36 108.5,87.3 108.5,82.01 SV1.34 107.26,80.74 108.5,79.5 108.5,71.85 SV1.25 109.58,70.58 108.5,69.5 108.5,64.23 SV1.20 108.5,61.7 108.5,56.61 SV1.14 107.23,55.27 108.5,54 108.5,51.53 SV1.9 109.66,50.26 108.5,49.1 108.5,46.45 SV1.6 101.02,45.18 GND_LIDAR.1 98.2,44 94.3,40.1 34.8,40.1 34.6,39.9 | v26.1,28.4 24.3,26.6 v24.3,18.6 | GND_ROTOR2.MP GND_ROTOR.MP GND_ROTOR1.MP 8.7,176 GND_ROTOR3.MP 8.8,184 v10.4,185.6 10.5,185.7 v12.4,185.7 12.8,185.3 v15.4,185.3 17.7,183 SERVO_GND_CARG.MP 33.9,183 | GND_CARCASA.MP 35.8,193.31 35.8,184.8 34,183 33.9,183 | 33.9,183 34,182.9 34.8,182.9 35.8,181.9 35.8,176.5 35.1,175.8 SERVO_GND_GAT.MP 33.5,175.8 35.9,173.4 35.9,168.3 v35.1,167.5 | v35,164.1 35,163.3 34.4,162.7 21,162.7 16.4,158.1 16.4,108.4 38.2,96.4 38.2,55.4 34.6,51.8 34.6,39.9 | 34.6,39.9 34.6,39.1 v31.8,36.3 | v2.9,59.8 2.9,54.1 11.2,45.8 20.9,45.8 26.1,40.6 v26.1,39.8
  POWER 0.406: 33.3,182.9 arc90 SERVO_GND_CARG.MP
  Bottom 0.2: v1.6,12.1 16.1,12.1 v16.5,11.7
GPIO-BTN1  (via drill 0.3)
  Top 0.2: J3.3 v136.9,39.1 | v117.1,47.8 117.1,47.72 SV1.7
  Bottom 0.2: v136.9,39.1 125.89,50.11 119.38,50.11 117.1,47.83 v117.1,47.8 117.18,47.72
GPIO-BTN2  (via drill 0.3)
  Top 0.2: J3.4 v135.9,41.9 | v122.8,55 v121.2,56.6
  Bottom 0.2: v135.9,41.9 v122.8,55 | v121.2,56.6 113.6,64.2 108.7,64.2 107.4,65.5 SV1.22
GPIO-LED1  (via drill 0.3)
  Top 0.2: J3.5 v134.9,44.7 | v123.6,56 v122.1,57.5
  Bottom 0.2: v134.9,44.7 v123.6,56 | v122.1,57.5 118.4,61.2 118.4,81.4 113.98,85.82 SV1.37
GPIO-LED2  (via drill 0.3)
  Top 0.2: J3.6 v133.9,40 | v121.5,53.9 v120,55.4 | v115,61.5 v115,64.2
  Bottom 0.2: v133.9,40 125.1,48.8 120.2,48.8 117.1,45.7 115.6,45.7 114.6,46.7 114.6,47 v121.5,53.9 | v120,55.4 115,60.4 v115,61.5 | v115,64.2 115,78.2 111.2,82 108.51,82 SV1.36
N$1
  Top 0.2: C1.1 8.5,19.3 IC1.1
N$6  (via drill 0.3)
  Top 0.2: IC1.7 IC1.8 7.08,22.47 5.4,20.79 5.4,19.8 4.45,18.85 R5.2 3.85,18.85 4.6,18.1 C1.2 5.8,18 v5.8,16.9 | R7.1 4.1,10.55 | 4.1,10.55 R6.2 | v4.1,12.9 4.1,10.55
  Bottom 0.2: v5.8,16.9 4.1,15.4 v4.1,12.9
N$7  (via drill 0.3 pad 0.2)  (1 unrouted)
  Top 0.2: R4.2 10.44,2.05 v10.46,2.03
  POWER 0.2: v10.46,2.03 15.65,2.03 v25.05,11.43
N$10  (via drill 0.3)
  Top 0.2: U1.1 9.06,32 v7.5,32 | v3.5,31.5 C2.1 C3.1
  GND_PLANE 0.2: v7.5,32 7,31.5 v3.5,31.5
N$12  (via drill 0.2 pad 0.2, 0.3 pad 0.2)
  Top 0.2: IC1.2 8.97,22.82 v9.4,22.4 | v3.7,28 C3.2 | R9.2 15.3,27.95 15.7,27.95 15.7,26.8 14.2,25.3 11.8,25.3 10.6,26.5 10,26.5 9.95,26.55 | 9.95,26.55 R8.2 10.3,28 11.4,29.1 U1.2 | v9.4,26.3 9.7,26.3 9.95,26.55
  Bottom 0.2: v9.4,22.4 9.4,22.1 9.1,21.8 7.6,21.8 6.5,22.9 6.5,25.2 v3.7,28 4.8,28 6.2,26.6 8.5,26.6 8.8,26.3 v9.4,26.3
N$13
  pour GND_PLANE (isolate 0.254): -5.3,219 -5.3,-7.7 -5.1,-7.9 46.5,-7.9 46.5,15.4 155.9,16.8 155.8,106.8 93,106.8 93,59.6 47,59.8 47.1,218.1
N$15  (via drill 0.3)
  Top 0.406: IC2.8 21.39,34.9 v20.7,34.2 | v24.3,31.7 R2.2
  POWER 0.406: v20.7,34.2 20.7,33.2 22.2,31.7 v24.3,31.7
OPI_CAN_RX  (via drill 0.3)
  Top 0.406: v30.8,38.7 IC2.4
  Bottom 0.406: SV1.3 109.77,42.77 111.8,44.8 111.8,45.5 110.77,46.45 106.66,46.44 99.7,39.5 31.6,39.5 v30.8,38.7
OPI_CAN_TX  (via drill 0.3)
  Top 0.406: v30.8,34.8 28.45,34.8 IC2.1
  Bottom 0.406: SV1.5 108.49,43.9 106.1,43.9 101.2,39 36.5,39 32.3,34.8 v30.8,34.8
PWM_GATILLO_OPI  (via drill 0.3)
  Top 0.406: R0_GAT_OPI.1 v34.9,161.4 | v29.2,159.9 19.6,159.9 v17.5,157.8 | v36.8,51.9 36.8,49 v36.7,48.9
  Bottom 0.406: v34.9,161.4 34.9,160.3 34.5,159.9 v29.2,159.9 | v17.5,157.8 17.5,108.9 39,97.1 39,54.1 v36.8,51.9 | v36.7,48.9 36.7,48.3 37.6,47.4 86.2,47.4 89.2,44.4 99.8,44.4 103.3,47.9 103.3,55.5 104.4,56.6 108.49,56.6 SV1.15
PWM_GATILLO_PORT  (via drill 0.3)
  Top 0.406: J1.7 9.4,186.3 v6.8,183.7 | v16.9,163.8 v21.3,163.8 | v35.1,157.3 35.1,158.1 34.5,158.7 R0_GAT_PORT.2
  Bottom 0.406: v6.8,183.7 6.8,167.2 8.7,165.3 15.3,165.3 16.8,163.8 v16.9,163.8 | v21.3,163.8 23.2,163.8 30,157 34.8,157 v35.1,157.3
PWM_SYNC  (via drill 0.3)
  Top 0.2: J1.5 11.5,188.38 v11.5,190.3
  Top 0.406: v31.65,169.17 R3.2 27.7,166.8 v22.9,162
  Bottom 0.406: SV1.32 103.3,78.2 102.7,78.2 101.1,76.6 101.1,51.1 99.9,49.9 41.9,49.9 41.4,50.4 41.4,98.7 20.1,110.3 20.1,159.2 v22.9,162 | v11.5,190.3 15.6,190.3 19,186.9 22.9,186.9 29.5,180.3 29.5,170.92 v31.65,169.17
RX_LIDAR
  Bottom 0.2: RX_LIDAR.1 94,48.6 94.6,49.2 100.2,49.2 101.8,50.8 101.8,72.3 103.9,74.4 107.9,74.4 108.5,75 108.5,76.93 SV1.31
SCL1  (via drill 0.2 pad 0.2, 0.3 pad 0.2)  (1 unrouted)
  Top 0.2: v8.1,30.1 8.1,28.05 R8.1 8,27.95 v8,25.9 | IC1.3 9.62,23.18 v10.35,23.9
  Bottom 0.2: 127.9,62 113.2,47.3 113.2,40.8 111,38.6 36.8,38.6 28.2,30 15.6,30 15.1,30.5 8.5,30.5 v8.1,30.1 8.4,29.8 11.3,29.8 13.5,27.6 13.6,27.6 | v10.35,23.9 10,23.9 v8,25.9
SCL2  (via drill 0.2 pad 0.2, 0.3 pad 0.2)
  Top 0.2: J2.20 v26.55,18.03 | IC1.6 v4.81,23.17 3.82,23.17 2.7,22.05 R5.1
  Bottom 0.2: v26.55,18.03 26.55,18.55 25.8,19.3 23.8,19.3 21.4,21.7 10.3,21.7 9.5,20.9 7.08,20.9 v4.81,23.17
SDA1  (via drill 0.3 pad 0.2)  (1 unrouted)
  Top 0.2: v13.36,29.65 R9.1 | R9.1 | R9.1 arc90 13.3,27.95 v13.3,26.5 | v10.3,25 9.5,25 8.6,24.1 8.6,23.6 IC1.4
  Bottom 0.2: 127.5,61.2 113.5,47.2 113.5,40.7 111.1,38.3 36.9,38.3 28.25,29.65 v13.36,29.65 | v13.3,26.5 12.8,26.5 11.3,25 v10.3,25
SDA2  (via drill 0.2 pad 0.2, 0.3)  (1 unrouted)
  Top 0.2: IC1.5 6.48,23.52 v5.2,24.8 | R6.1 v5.9,7.1
  Bottom 0.2: 30.6,19 29.7,19.9 24,19.9 21.4,22.5 10.4,22.5 9.2,21.3 7.4,21.3 6,22.7 6,24 v5.2,24.8 2.3,24.8 0.6,23.1 0.6,7.3 1.2,6.7 5.5,6.7 v5.9,7.1
SERVO_CARGADOR_DATA  (via drill 0.3)
  Top 0.406: v25.5,186 v23.8,184.3 | v39.4,51.8 v39.4,49.5 | v18,176.7 v18,173.7
  Bottom 0.406: SERVO_DATA_CARG.MP 31.4,191.9 v25.5,186 | v23.8,184.3 18,178.5 v18,176.7 | v39.4,51.8 40,52.4 40,97.8 18.9,109.3 18.6,109.6 18.6,159.8 18,160.4 v18,173.7 | v39.4,49.5 39.4,49.2 40.2,48.4 87.1,48.4 89.8,45.7 99.7,45.7 102.4,48.4 102.4,56.4 103.9,57.9 107.21,57.9 SV1.16
SERVO_GATILLO_DATA  (via drill 0.3)
  Top 0.406: v30.2,164.1 10K_GND.1 R0_GAT_OPI.2 R0_GAT_PORT.1
  Bottom 0.406: SERVO_DATA_GAT.MP 33.4,168.6 32.9,168.1 30.7,168.1 30.2,167.6 v30.2,164.1
TX_LIDAR
  Bottom 0.2: TX_LIDAR.1 91.9,48.8 92.6,49.5 100.1,49.5 101.5,50.9 101.5,74.7 103.6,76.8 107.8,76.8 108.5,77.5 108.5,79.47 SV1.33
VCC_3.3V  (via drill 0.3)
  Top 0.2: v132.9,34.1 J3.7
  Top 0.406: IC2.3 28.39,37.4 30.7,37.4 v30.8,37.3
  POWER 0.2: SV1.1 109.77,40.13 108.5,41.4 108.5,63.8 108.9,64.2 112.4,64.2 113.3,63.3 139,63.3 140.3,62 140.3,33.8 139.4,32.9 133.2,32.9 132.9,33.2 v132.9,34.1
  POWER 0.406: SV1.1 109.77,39.27 107.8,37.3 v30.8,37.3

### Text on the board
tNames: K1 - Zen V0.1 Rev.3.6 / by Cypress Technologies S.L.